# Altium schematic sheet XBeeRainGuage.SchDoc
size A1
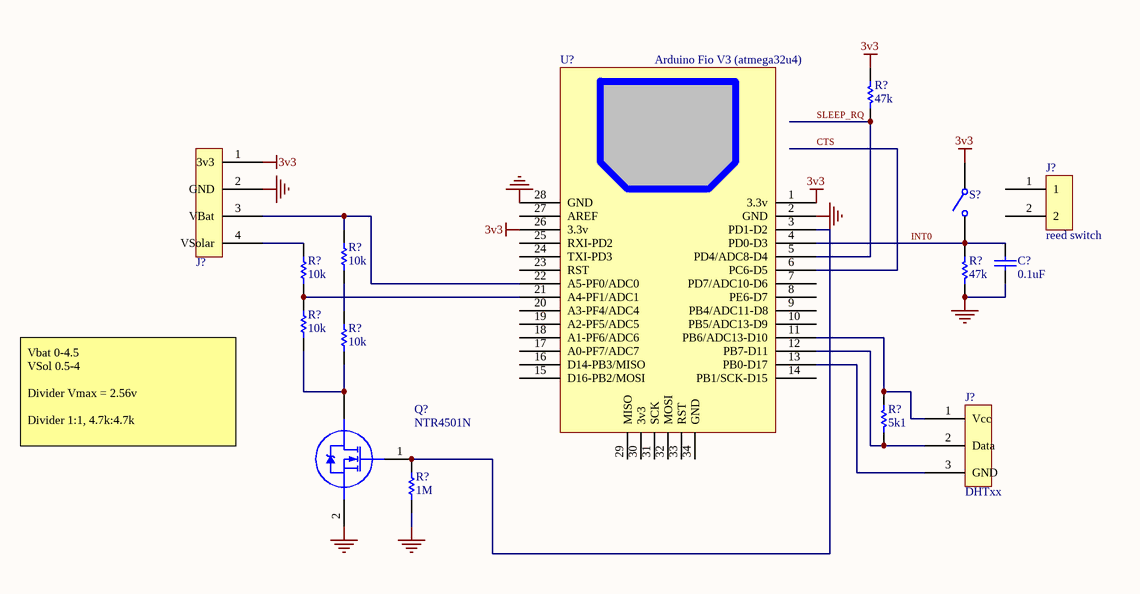
[diagram p0: XBeeRainGuage.SchDoc]

## Parts
(Parts that share a designator on the sheet are numbered #1, #2 ... from top to bottom, then left to right.)
C?  value 0.1uF  [Cap SMD 0805A]  (hidden comment: Cap)
J?#1  SIP4 CONNECTOR  [0.1 SIP 4 PIN]  (value not drawn)
J?#2  reed switch  [0.1 SIP 2 PIN]
J?#3  DHTxx  [HDR3]
Q?  NTR4501N  [SO-G3]
R?#1  value 47k  [Res SMD 0805A]  (hidden comment: Res1)
R?#2  value 10k  [Res SMD 0805A]  (hidden comment: Res1)
R?#3  value 10k  [Res SMD 0805A]  (hidden comment: Res1)
R?#4  value 47k  [Res SMD 0805A]  (hidden comment: Res1)
R?#5  value 10k  [Res SMD 0805A]  (hidden comment: Res1)
R?#6  value 10k  [Res SMD 0805A]  (hidden comment: Res1)
R?#7  value 5k1  [Res SMD 0805A]  (hidden comment: Res1)
R?#8  value 1M  [Res SMD 0805A]  (hidden comment: Res1)
S?  SW-PB-SPST  [SPST Micro Tactile]  (value not drawn)
U?  Arduino Fio V3 (atmega32u4)  [Arduino Fio V3]

## Nets
3v3: J?#1.1(3v3) R?#1.2 S?.1 U?.1(3.3v) U?.26(3.3v)
GND: C?.2 J?#1.2(GND) Q?.2(S) R?#4.1 R?#8.1 U?.2(GND) U?.28(GND)
CTS: U?.6(PC6-D5)
INT0: C?.1 R?#4.2 S?.2 U?.4(PD0-D3)
SLEEP_RQ: R?#1.1 U?.5(PD4/ADC8-D4)
NetJ?#1_3: J?#1.3(VBat) R?#2.2 U?.22(A5-PF0/ADC0)
NetJ?#1_4: J?#1.4(VSolar) R?#3.2
NetJ?#3_1: J?#3.1(Vcc) R?#7.2 U?.11(PB6/ADC13-D10)
NetJ?#3_2: J?#3.2(Data) R?#7.1 U?.12(PB7-D11)
NetJ?#3_3: J?#3.3(GND) U?.13(PB0-D17)
NetQ?_1: Q?.1(G) R?#8.2 U?.3(PD1-D2)
NetQ?_3: Q?.3(D) R?#5.1 R?#6.1
NetR?#2_1: R?#2.1 R?#6.2
NetR?#3_1: R?#3.1 R?#5.2 U?.21(A4-PF1/ADC1)

Not connected (* = marked no-connect by the designer): J?#2 1 2; U? 7(PD7/ADC10-D6) 8(PE6-D7) 9(PB4/ADC11-D8) 10(PB5/ADC13-D9) 14(PB1/SCK-D15) 15(D16-PB2/MOSI) 16(D14-PB3/MISO) 17(A0-PF7/ADC7) 18(A1-PF6/ADC6) 19(A2-PF5/ADC5) 20(A3-PF4/ADC4) 23(RST) 24(TXI-PD3) 25(RXI-PD2) 27(AREF) 29(MISO) 30(3v3) 31(SCK) 32(MOSI) 33(RST) 34(GND)

## Notes on the sheet
- Vbat 0-4.5
  VSol 0.5-4
  Divider Vmax = 2.56v
  Divider 1:1, 4.7k:4.7k

## Library data of the parts
C? = Cap: Capacitor; Published: 8-Jun-2000; LatestRevisionDate: 17-Jul-2002; LatestRevisionNote: Re-released for DXP Platform.; PackageReference: RAD-0.3; Publisher: Altium Limited; PackageDescription: Radial Cap, Thru-Hole; 2 Leads; 0.3 in Pin Spacing
J?#2 = SIP2 CONNECTOR
J?#3 = SIP3 CONNECTOR
Q? = NTR4501N: HEXFET Power MOSFET; Revision 1: 29-Sep-2000: Re-orientated a 'Drain' pin on first part.; Revision 2: 17-Jul-2002: Re-released for DXP Platform.; Package Information: Latest Revision: Feb-2001; Code - JEDEC: MS-012-AA; Published: 8-Jun-2000; Datasheet: Latest Revision: Dec-1997; Package Reference: SO-8; Publisher: Altium Limited
R?#1-R?#8 = Resistor
S? = SW-PB-SPST: Push Button, Single-Pole, Single-Throw; Published: 24-Mar-1999; Revision: July-2002: Re-released for DXP Platform.; Publisher: Altium Limited
U? = Arduion Fio V3 atmega32u4